# Altium schematic sheet INS_Visualizer.SchDoc: INS_Visualizer
size A4; Author: Daria Mykhailova; Organization: Kiyv Aviation Institute; Revision: v1; SheetNumber: 1; SheetTotal: 1
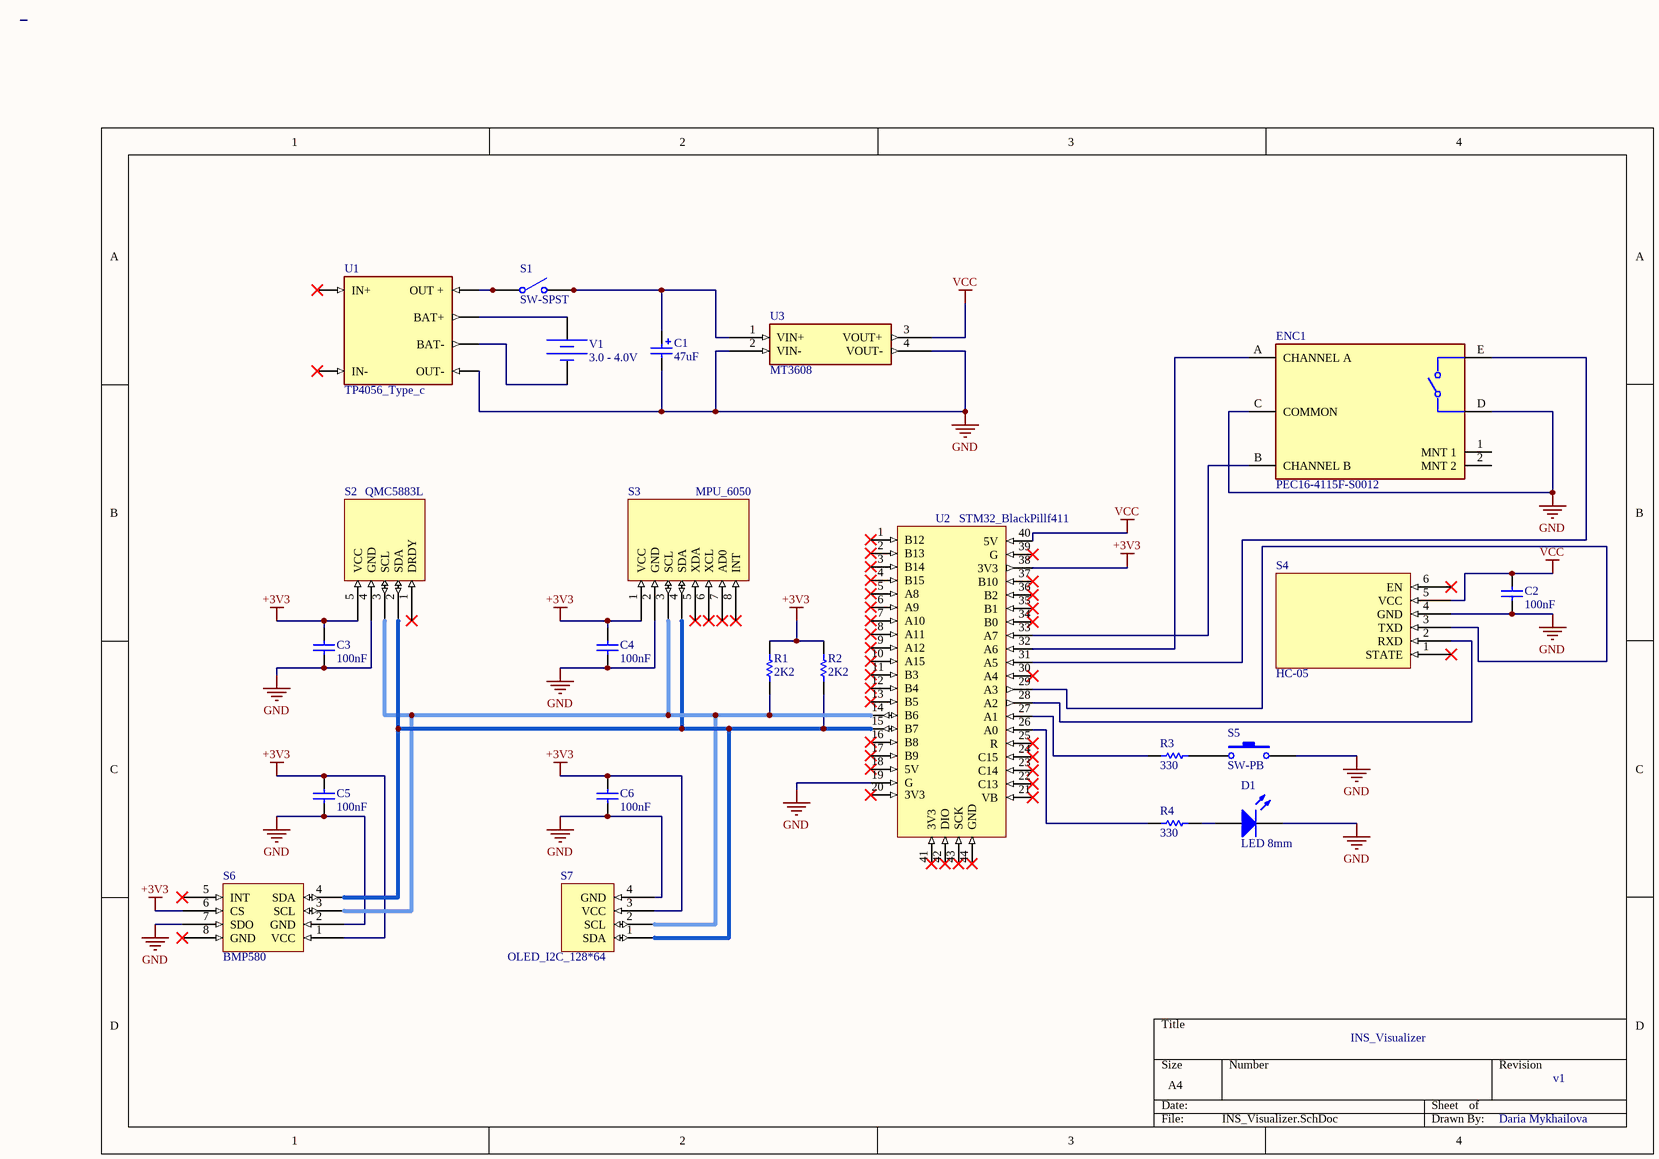
[diagram p0: INS_Visualizer.SchDoc]

## Parts
C1  value 47uF  [Capacitor Pol]  (hidden comment: Capacitor Pol)
C2  value 100nF  [CAPACITOR CER]  (hidden comment: Capacitor Cer)
C3  value 100nF  [CAPACITOR CER]  (hidden comment: Capacitor Cer)
C4  value 100nF  [CAPACITOR CER]  (hidden comment: Capacitor Cer)
C5  value 100nF  [CAPACITOR CER]  (hidden comment: Capacitor Cer)
C6  value 100nF  [CAPACITOR CER]  (hidden comment: Capacitor Cer)
D1  LED 8mm  [LED]
ENC1  PEC16-4115F-S0012  [FP-PEC16-4115F-S0012-MFG]
R1  value 2K2  [Resistor]  (hidden comment: Resistor)
R2  value 2K2  [Resistor]  (hidden comment: Resistor)
R3  value 330  [Resistor]  (hidden comment: Resistor)
R4  value 330  [Resistor]  (hidden comment: Resistor)
S1  SW-SPST  [SPST-2]
S2  QMC5883L  [QMC5883L]
S3  MPU_6050  [MPU6050_HDR1X8]
S4  HC-05  [HC-05_HDR1x6H]
S5  SW-PB  [SPST-2]
S6  BMP580  [BMP580_HDR1x4]
S7  OLED_I2C_128*64  [OLED_HDR1x4]
U1  TP4056_Type_c  [TP4056_TYPE_C]
U2  STM32_BlackPillf411  [STM32_HDR2x20]
U3  MT3608  [MT3608]
V1  DC Magnitude: 3.0 - 4.0V  [BATTERY]  (hidden comment: Constant Voltage Source)

## Nets
+3V3: C3.2 C4.2 C5.2 C6.2 R1.2 R2.2 S2.5(VCC) S3.1(VCC) S6.1(VCC) S6.6(CS) S7.3(VCC) U2.38(3V3)
GND: C1.2 C2.1 C3.1 C4.1 C5.1 C6.1 D1.2 ENC1.C(COMMON) ENC1.D S2.4(GND) S3.2(GND) S4.4(GND) S5.2 S6.2(GND) S6.7(SDO) S7.4(GND) U1.OUT_N(OUT-) U2.19(G) U3.2(VIN-) U3.4(VOUT-)
VCC: C2.2 S4.5(VCC) U2.40(5V) U3.3(VOUT+)
NetC1_1: C1.1 S1.2(NO) U3.1(VIN+)
NetD1_1: D1.1 R4.1
NetENC1_A: ENC1.A(CHANNEL_A) U2.32(A6)
NetENC1_B: ENC1.B(CHANNEL_B) U2.33(A7)
NetENC1_E: ENC1.E U2.31(A5)
NetR1_1: R1.1 S2.3(SCL) S3.3(SCL) S6.3(SCL) S7.2(SCL) U2.14(B6)
NetR2_1: R2.1 S2.2(SDA) S3.4(SDA) S6.4(SDA) S7.1(SDA) U2.15(B7)
NetR3_1: R3.1 S5.1
NetR3_2: R3.2 U2.27(A1)
NetR4_2: R4.2 U2.26(A0)
NetS1_1: S1.1(COMMON) U1.OUT_P(OUT_+)
NetS4_2: S4.2(RXD) U2.28(A2)
NetS4_3: S4.3(TXD) U2.29(A3)
NetU1_BAT_N: U1.BAT_N(BAT-) V1.2
NetU1_BAT_P: U1.BAT_P(BAT+) V1.1

Not connected (* = marked no-connect by the designer): ENC1 1(MNT_1) 2(MNT_2); S2 1(DRDY)*; S3 5(XDA)* 6(XCL)* 7(AD0)* 8(INT)*; S4 1(STATE)* 6(EN)*; S6 5(INT)* 8(GND)*; U1 IN_N(IN-)* IN_P(IN+)*; U2 1(B12)* 2(B13)* 3(B14)* 4(B15)* 5(A8)* 6(A9)* 7(A10)* 8(A11)* 9(A12)* 10(A15)* 11(B3)* 12(B4)* 13(B5)* 16(B8)* 17(B9)* 18(5V)* 20(3V3)* 21(VB)* 22(C13)* 23(C14)* 24(C15)* 25(R)* 30(A4)* 34(B0)* 35(B1)* 36(B2)* 37(B10)* 39(G)* 41(3V3)* 42(DIO)* 43(SCK)* 44(GND)*

## Library data of the parts
C1 = Capacitor Pol: Polarized Capacitor (Radial); Published: 8-Jun-2000; LatestRevisionDate: 17-Jul-2002; LatestRevisionNote: Re-released for DXP Platform.; PackageReference: RB7.6-15; Publisher: Altium Limited; PackageDescription: Polarized Capacitor (Radial); 2 Leads
ENC1 = CMP-07421-000056-1: ROTARY ENCODER MECHANICAL 12PPR; Pulses per Revolution: 12; Built in Switch: Yes; Output Type: Quadrature; Number of Channels: 2; Operating Supply Voltage: 5V; Min Operating Temperature: -30°C; Package Quantity: 50; Length: 23mm; Height: 17.3mm; Mount: Through Hole; Termination: PC Pin; Encoder Type: Mechanical; Max Operating Temperature: 70°C; Orientation: Vertical; RoHS Compliant: Yes; Series: PEC16; Width: 16mm; Detent: Yes
S1 = SW-SPST: Single-Pole, Single-Throw Switch; Published: 24-Mar-1999; LatestRevisionDate: 17-Jul-2002; LatestRevisionNote: Re-released for DXP Platform.; PackageReference: SPST-2; Publisher: Altium Limited; PackageDescription: Switch; 2 Leads
S5 = SW-PB: Switch; Published: 24-Mar-1999; LatestRevisionDate: 17-Jul-2002; LatestRevisionNote: Re-released for DXP Platform.; PackageReference: SPST-2; Publisher: Altium Limited; PackageDescription: Switch; 2 Leads
U1 = TP4056_Type_c: The TP4056ES Li-Ion charger is an improved version of the TP4056, ideal for 18650 batteries, with a micro USB connection for direct PC charging.; MF: Generic; MP: TP4056 Micro-USB Charger - 1A; SnapEDA_Link: https://www.snapeda.com/parts/TP4056%20Micro-USB%20Charger%20-%201A/Generic/view-part/?ref=snap; Package: Package; Value: *; Check_prices: https://www.snapeda.com/parts/TP4056%20Micro-USB%20Charger%20-%201A/Generic/view-part/?ref=eda
V1 = Battery: SimulationGenericComponent: True
C2-C6 = Capacitor Cer: Published: 8-Jun-2000; LatestRevisionDate: 17-Jul-2002; LatestRevisionNote: Re-released for DXP Platform.; PackageReference: RAD-0.3; Publisher: Altium Limited; PackageDescription: Radial Cap, Thru-Hole; 2 Leads; 0.3 in Pin Spacing
R1-R4 = Resistor: Published: 8-Jun-2000; LatestRevisionDate: 17-Jul-2002; LatestRevisionNote: Re-released for DXP Platform.; PackageReference: AXIAL-0.3; Publisher: Altium Limited; PackageDescription: Axial Device, Thru-Hole; 2 Leads; 0.3 in Pin Spacing